# Altium schematic sheet УШЯИ.411618.029Э Э3 Лист 3new.schdoc
size 420 x 297 mm; SheetNumber: 3; SheetTotal: 7
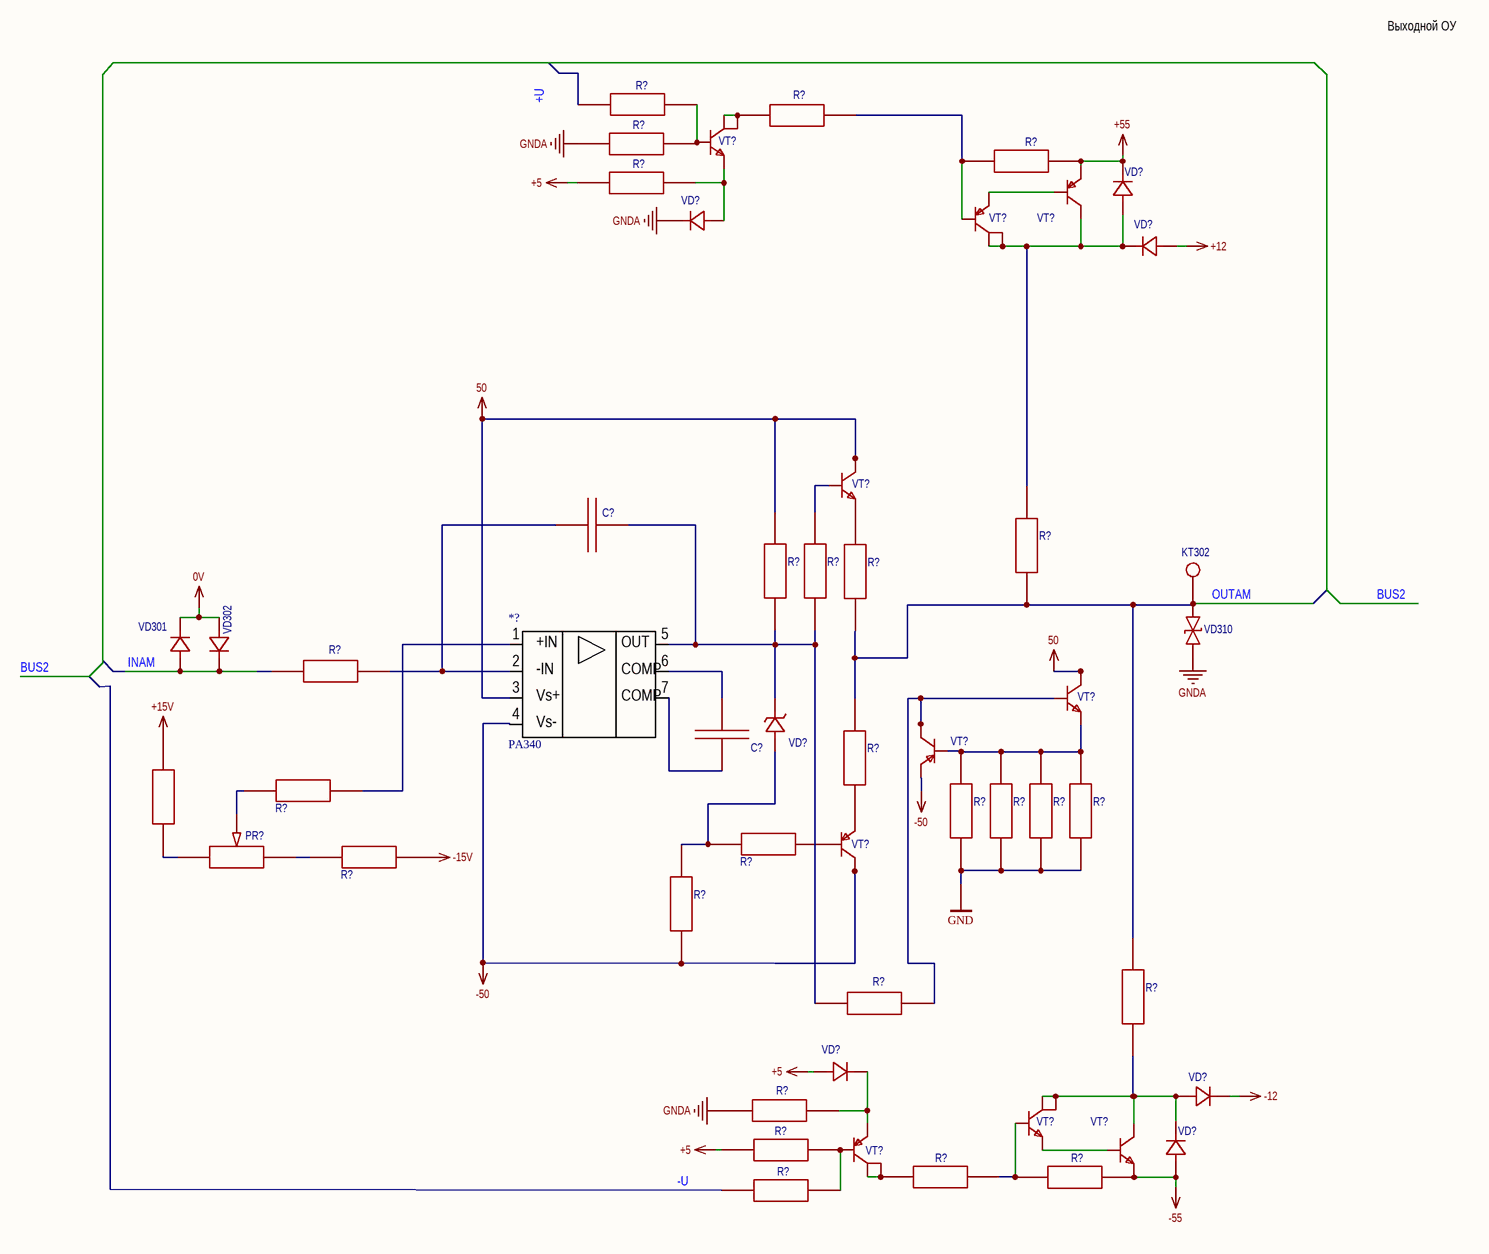
[diagram p0: УШЯИ.411618.029Э Э3 Лист 3new.schdoc]

## Parts
(Parts that share a designator on the sheet are numbered #1, #2 ... from top to bottom, then left to right.)
*?  PA340
?  Резистор 10кОм 0,125Вт 1% [0805]  [R0805]  (value not drawn)
C?#1  Конденсатор SMD 10пФ 100В X7R 10% [0805]  [C0805]  (value not drawn)
C?#2  Конденсатор SMD 30пФ 100В X7R 10% [0805]  [C0805]  (value not drawn)
KT302  Control point  (value not drawn)
PR?  Резистор переменный 3329Н 3.3 кОм  [RES-ADJ-TH_3329H]  (value not drawn)
R?#1  Резистор 3кОм 0,125Вт 1% [0805]  [R0805]  (value not drawn)
R?#2  Резистор 18кОм 0,125Вт 1% [0805]  [R0805]  (value not drawn)
R?#3  Резистор 2.4кОм 0,125Вт 1% [0805]  [R0805]  (value not drawn)
R?#4  Резистор 1.5кОм 0,125Вт 1% [0805]  [R0805]  (value not drawn)
R?#5  Резистор 7.2кОм 0,125Вт 1% [0805]  [R0805]  (value not drawn)
R?#6  Резистор 3кОм 0,125Вт 1% [0805]  [R0805]  (value not drawn)
R?#7  Резистор 10кОм 0,125Вт 1% [0805]  [R0805]  (value not drawn)
R?#8  Резистор 24Ом 0,125Вт 1% [0805]  [R0805]  (value not drawn)
R?#9  Резистор 3кОм 0,125Вт 1% [0805]  [R0805]  (value not drawn)
R?#10  Резистор 4кОм 0,125Вт 1% [0805]  [R0805]  (value not drawn)
R?#11  Резистор 3кОм 0,125Вт 1% [0805]  [R0805]  (value not drawn)
R?#12  Резистор 5кОм 0,125Вт 1% [0805]  [R0805]  (value not drawn)
R?#13  Резистор 3кОм 0,125Вт 1% [0805]  [R0805]  (value not drawn)
R?#14  Резистор 3кОм 0,125Вт 1% [0805]  [R0805]  (value not drawn)
R?#15  Резистор 3кОм 0,125Вт 1% [0805]  [R0805]  (value not drawn)
R?#16  Резистор 3кОм 0,125Вт 1% [0805]  [R0805]  (value not drawn)
R?#17  Резистор 24Ом 0,125Вт 1% [0805]  [R0805]  (value not drawn)
R?#18  Резистор 10кОм 0,125Вт 1% [0805]  [R0805]  (value not drawn)
R?#19  Резистор 10кОм 0,125Вт 1% [0805]  [R0805]  (value not drawn)
R?#20  Резистор 3кОм 0,125Вт 1% [0805]  [R0805]  (value not drawn)
R?#21  Резистор 3кОм 0,125Вт 1% [0805]  [R0805]  (value not drawn)
R?#22  Резистор 7.2кОм 0,125Вт 1% [0805]  [R0805]  (value not drawn)
R?#23  Резистор 2.4кОм 0,125Вт 1% [0805]  [R0805]  (value not drawn)
R?#24  Резистор 18кОм 0,125Вт 1% [0805]  [R0805]  (value not drawn)
R?#25  Резистор 1.5кОм 0,125Вт 1% [0805]  [R0805]  (value not drawn)
R?#26  Резистор 3кОм 0,125Вт 1% [0805]  [R0805]  (value not drawn)
VD301  Диод импульсный 1N4448 [SOD-123]  [SOD-123_L2.7-W1.6-LS3.7-RD-1]  (value not drawn)
VD302  Диод импульсный 1N4448 [SOD-123]  [SOD-123_L2.7-W1.6-LS3.7-RD-1]  (value not drawn)
VD310  Диод защитный 1.5KE56CA [DO-201AD/DO-27]  [DO-201]  (value not drawn)
VD?#1  Диод RS1M [SMA] (допускается замена на FR307 [DO-201AD])  (value not drawn)
VD?#2  Диод импульсный 1N4448 [SOD-123]  [SOD-123_L2.7-W1.6-LS3.7-RD-1]  (value not drawn)
VD?#3  Диод КД2970А [TO-220AC]  [TO-220AC-2_L10.0-W4.5-P5.08-T]  (value not drawn)
VD?#4  Стабилитрон MMSZ5232B 5.6В 0.5Вт [SOD123]  [SOD-123_L2.7-W1.6-LS3.7-RD]  (value not drawn)
VD?#5  Диод импульсный 1N4448 [SOD-123]  [SOD-123_L2.7-W1.6-LS3.7-RD-1]  (value not drawn)
VD?#6  Диод MBR10100 [TO-220AC]  [TO-220AC-2_L10.0-W4.5-P5.08-T]  (value not drawn)
VD?#7  Диод RS1M [SMA] (допускается замена на FR307 [DO-201AD])  (value not drawn)
VT?#1  Транзистор DZTA42 NPN [SOT223]  [SOT-223-4_L6.5-W3.5-P2.30-LS7.0-BR]  (value not drawn)
VT?#2  Транзистор MJE5730G PNP [TO-220-3]  [TO-220-3_L10.0-W4.5-P2.54-L]  (value not drawn)
VT?#3  Транзистор DZTA92 PNP [SOT223]  [SOT-223-3_L6.5-W3.4-P2.30-LS7.0-BR]  (value not drawn)
VT?#4  Транзистор TIP142 NPN [SOT223]  [SOT-223_L6.5-W3.5-P2.30-LS7.0-BR]  (value not drawn)
VT?#5  Транзистор ZTX658 NPN [SOT223]  [SOT-223_L6.5-W3.5-P2.30-LS7.0-BR]  (value not drawn)
VT?#6  Транзистор ZTX758 PNP [SOT223]  [SOT-223_L6.5-W3.5-P2.30-LS7.0-BR]  (value not drawn)
VT?#7  Транзистор TIP147 PNP [SOT223]  [SOT-223_L6.5-W3.5-P2.30-LS7.0-BR]  (value not drawn)
VT?#8  Транзистор DZTA42 NPN [SOT223]  [SOT-223-4_L6.5-W3.5-P2.30-LS7.0-BR]  (value not drawn)
VT?#9  Транзистор DZTA92 PNP [SOT223]  [SOT-223-3_L6.5-W3.4-P2.30-LS7.0-BR]  (value not drawn)
VT?#10  Транзистор TIP48 NPN [TO-220-3]  [TO-220-3_L10.0-W4.5-P2.54-L]  (value not drawn)

## Nets
0V: VD301.1(C) VD302.2(A)
50: *?.19 R?#7.2 VT?#4.2(C) VT?#4.4(C) VT?#5.2(C) VT?#5.4(C)
+5: R?#5.1 R?#23.1 VD?#5.2(A)
+12: VD?#3.3(A)
+15V: ?.1
+55: R?#4.2 VD?#1.1(K) VT?#2.3(E)
-12: VD?#6.1(K)
-15V: R?#18.1
-50: *?.18 R?#19.1 VT?#6.3(E) VT?#7.2(C) VT?#7.4(C)
-55: R?#25.2 VD?#7.2(A) VT?#10.3(E)
GND: R?#13.1 R?#14.1 R?#15.1 R?#16.1
GNDA: R?#3.1 R?#22.1 VD310.1 VD?#2.1(C)
-U: R?#26.1
INAM: R?#10.1 VD301.2(A) VD302.1(C)
OUTAM: KT302.1 R?#6.1 R?#9.1 R?#11.2 R?#20.2 VD310.2
Net*?_15: *?.15 C?#1.1 R?#7.1 R?#8.1 R?#21.1 VD?#4.1(K)
Net*?_16: *?.16 C?#2.1
Net*?_17: *?.17 C?#2.2
Net*?_20: *?.20 C?#1.2 R?#10.2
Net*?_21: *?.21 R?#12.2
Net?_2: ?.2 PR?.3
NetPR?_1: PR?.1 R?#18.2
NetPR?_2: PR?.2 R?#12.1
NetR?#1_2: R?#1.2 R?#3.2 VT?#1.1(B)
NetR?#2_1: R?#2.1 VT?#1.2(C) VT?#1.4(C)
NetR?#2_2: R?#2.2 R?#4.1 VT?#3.1(B)
NetR?#5_2: R?#5.2 VD?#2.2(A) VT?#1.3(E)
NetR?#6_2: R?#6.2 VD?#1.2(A) VD?#3.1(K) VT?#2.2(C) VT?#3.2(C) VT?#3.4(C)
NetR?#8_2: R?#8.2 VT?#4.1(B)
NetR?#9_2: R?#9.2 VT?#4.3(E)
NetR?#11_1: R?#11.1 VT?#7.3(E)
NetR?#13_2: R?#13.2 R?#14.2 R?#15.2 R?#16.2 VT?#5.3(E) VT?#6.1(B)
NetR?#17_1: R?#17.1 VT?#7.1(B)
NetR?#17_2: R?#17.2 R?#19.2 VD?#4.2(A)
NetR?#20_1: R?#20.1 VD?#6.3(A) VD?#7.1(K) VT?#8.2(C) VT?#8.4(C) VT?#10.2(C)
NetR?#21_2: R?#21.2 VT?#5.1(B) VT?#6.2(C) VT?#6.4(C)
NetR?#22_2: R?#22.2 VD?#5.1(C) VT?#9.3(E)
NetR?#23_2: R?#23.2 R?#26.2 VT?#9.1(B)
NetR?#24_1: R?#24.1 VT?#9.2(C) VT?#9.4(C)
NetR?#24_2: R?#24.2 R?#25.1 VT?#8.1(B)
NetVT?#2_1: VT?#2.1(B) VT?#3.3(E)
NetVT?#8_3: VT?#8.3(E) VT?#10.1(B)

Not connected (* = marked no-connect by the designer): R?#1 1

## Buses and harness runs
bus BUS2

## Notes on the sheet
- Выходной ОУ
- Labels drawn without touching a wire or pin: +U
- Подп. и дата
- Инв.№ дубл.
- Взам.инв.№
- Подп.и дата
- Инв.№ подл.
- Изм.
- Лист
- № докум.
- Подп.
- Дата
- Формат  A3
- (in symbol PA340) 1; 5; +IN; OUT; 2; 6; -IN; COMP; 3; 7; Vs+; 4; Vs-

## Library data of the parts
? R?#6-R?#21 = Резистор 3кОм 0,125Вт 1% [0805]: Contributor: jordanjin; Convert to PCB: yes; UniqueId: gge43217f4089893af2; ModelId: de27d504f5024d53a3020ec2611f5e5e; Origin Footprint: R0805; Device: Резистор 3кОм 0,125Вт 1% [0805]; Symbol: Резистор 3кОм 0,125Вт 1% [0805]; Manufacturer Part: R0805; spicePre: R; spiceSymbolName: Резистор 12кОм 0,125Вт 1% [0805]; Add into BOM: yes; FootprintName: R0805; ModelName: R0805
C?#1 C?#2 = Конденсатор SMD 10пФ 100В X7R 10% [0805]: Contributor: jordanjin; Convert to PCB: yes; UniqueId: ggedef2608488099cc0; Origin Footprint: C0805; Device: Конденсатор SMD 10пФ 100В X7R 10% [0805]; Symbol: Конденсатор SMD 10пФ 100В X7R 10% [0805]; Manufacturer Part: C0805; spicePre: C; spiceSymbolName: Конденсатор SMD 100нФ 100В X7R 10% [0805]; Add into BOM: yes; FootprintName: C0805
KT302 = Control point: Contributor: jordanjin; Convert to PCB: yes; UniqueId: ggefca8c0d1c63d776a; Origin Footprint: CONTROL POINT; Device: Control point; Symbol: Control point; Manufacturer Part: Control point; spicePre: K; spiceSymbolName: Control point; Add into BOM: yes
PR? = 47кОм: Manufacturer: BOCHEN; Manufacturer Part: 3329H; nameAlias: Value; Contributor: jordanjin; Convert to PCB: yes; UniqueId: gge1fcb3b6f1d9b0ac2; ModelId: 23beb460a8f44fd4bbfb4488e320892f; Origin Footprint: RES-ADJ-TH_3329H; Device: 47кОм; Symbol: 47кОм; Supplier: LCSC; JLCPCB Part Class: Extended Part; spicePre: R; spiceSymbolName: Резистор подстроречный 47кОм [3329H]; Add into BOM: yes; Resistance: 47кОм; FootprintName: RES-ADJ-TH_3329H; ModelName: RES-ADJ-TH_3329H
R?#1 = Резистор 3кОм 0,125Вт 1% [0805]: Contributor: jordanjin; Convert to PCB: yes; UniqueId: ggecdfd9e02ba7bc7b4; ModelId: de27d504f5024d53a3020ec2611f5e5e; Origin Footprint: R0805; Device: Резистор 3кОм 0,125Вт 1% [0805]; Symbol: Резистор 3кОм 0,125Вт 1% [0805]; Manufacturer Part: R0805; spicePre: R; spiceSymbolName: Резистор 12кОм 0,125Вт 1% [0805]; Add into BOM: yes; FootprintName: R0805; ModelName: R0805
R?#2 = Резистор 18кОм 0,125Вт 1% [0805]: Contributor: jordanjin; Convert to PCB: yes; UniqueId: gge5546a21a884c6307; ModelId: de27d504f5024d53a3020ec2611f5e5e; Origin Footprint: R0805; Device: Резистор 18кОм 0,125Вт 1% [0805]; Symbol: Резистор 18кОм 0,125Вт 1% [0805]; Manufacturer Part: R0805; spicePre: R; spiceSymbolName: Резистор 12кОм 0,125Вт 1% [0805]; Add into BOM: yes; FootprintName: R0805; ModelName: R0805
R?#3 = Резистор 2.4кОм 0,125Вт 1% [0805]: Contributor: jordanjin; Convert to PCB: yes; UniqueId: ggee22c828e250300a6; ModelId: de27d504f5024d53a3020ec2611f5e5e; Origin Footprint: R0805; Device: Резистор 2.4кОм 0,125Вт 1% [0805]; Symbol: Резистор 2.4кОм 0,125Вт 1% [0805]; Manufacturer Part: R0805; spicePre: R; spiceSymbolName: Резистор 12кОм 0,125Вт 1% [0805]; Add into BOM: yes; FootprintName: R0805; ModelName: R0805
R?#4 = Резистор 1.5кОм 0,125Вт 1% [0805]: Contributor: jordanjin; Convert to PCB: yes; UniqueId: gge3bd47006b7fd1579; ModelId: de27d504f5024d53a3020ec2611f5e5e; Origin Footprint: R0805; Device: Резистор 1.5кОм 0,125Вт 1% [0805]; Symbol: Резистор 1.5кОм 0,125Вт 1% [0805]; Manufacturer Part: R0805; spicePre: R; spiceSymbolName: Резистор 12кОм 0,125Вт 1% [0805]; Add into BOM: yes; FootprintName: R0805; ModelName: R0805
R?#5 = Резистор 7.2кОм 0,125Вт 1% [0805]: Contributor: jordanjin; Convert to PCB: yes; UniqueId: gge28b4fbf0dd659939; ModelId: de27d504f5024d53a3020ec2611f5e5e; Origin Footprint: R0805; Device: Резистор 7.2кОм 0,125Вт 1% [0805]; Symbol: Резистор 7.2кОм 0,125Вт 1% [0805]; Manufacturer Part: R0805; spicePre: R; spiceSymbolName: Резистор 12кОм 0,125Вт 1% [0805]; Add into BOM: yes; FootprintName: R0805; ModelName: R0805
R?#22 = Резистор 7.2кОм 0,125Вт 1% [0805]: Contributor: jordanjin; Convert to PCB: yes; UniqueId: gge859b26eaef412748; ModelId: de27d504f5024d53a3020ec2611f5e5e; Origin Footprint: R0805; Device: Резистор 7.2кОм 0,125Вт 1% [0805]; Symbol: Резистор 7.2кОм 0,125Вт 1% [0805]; Manufacturer Part: R0805; spicePre: R; spiceSymbolName: Резистор 12кОм 0,125Вт 1% [0805]; Add into BOM: yes; FootprintName: R0805; ModelName: R0805
R?#23 = Резистор 2.4кОм 0,125Вт 1% [0805]: Contributor: jordanjin; Convert to PCB: yes; UniqueId: gge5092b667f7a1fbe0; ModelId: de27d504f5024d53a3020ec2611f5e5e; Origin Footprint: R0805; Device: Резистор 2.4кОм 0,125Вт 1% [0805]; Symbol: Резистор 2.4кОм 0,125Вт 1% [0805]; Manufacturer Part: R0805; spicePre: R; spiceSymbolName: Резистор 12кОм 0,125Вт 1% [0805]; Add into BOM: yes; FootprintName: R0805; ModelName: R0805
R?#24 = Резистор 18кОм 0,125Вт 1% [0805]: Contributor: jordanjin; Convert to PCB: yes; UniqueId: gge9bc7b1efc6d85928; ModelId: de27d504f5024d53a3020ec2611f5e5e; Origin Footprint: R0805; Device: Резистор 18кОм 0,125Вт 1% [0805]; Symbol: Резистор 18кОм 0,125Вт 1% [0805]; Manufacturer Part: R0805; spicePre: R; spiceSymbolName: Резистор 12кОм 0,125Вт 1% [0805]; Add into BOM: yes; FootprintName: R0805; ModelName: R0805
R?#25 = Резистор 1.5кОм 0,125Вт 1% [0805]: Contributor: jordanjin; Convert to PCB: yes; UniqueId: gge53a59f0116c0d1f6; ModelId: de27d504f5024d53a3020ec2611f5e5e; Origin Footprint: R0805; Device: Резистор 1.5кОм 0,125Вт 1% [0805]; Symbol: Резистор 1.5кОм 0,125Вт 1% [0805]; Manufacturer Part: R0805; spicePre: R; spiceSymbolName: Резистор 12кОм 0,125Вт 1% [0805]; Add into BOM: yes; FootprintName: R0805; ModelName: R0805
R?#26 = Резистор 3кОм 0,125Вт 1% [0805]: Contributor: jordanjin; Convert to PCB: yes; UniqueId: ggef809131c8b71481b; ModelId: de27d504f5024d53a3020ec2611f5e5e; Origin Footprint: R0805; Device: Резистор 3кОм 0,125Вт 1% [0805]; Symbol: Резистор 3кОм 0,125Вт 1% [0805]; Manufacturer Part: R0805; spicePre: R; spiceSymbolName: Резистор 12кОм 0,125Вт 1% [0805]; Add into BOM: yes; FootprintName: R0805; ModelName: R0805
VD301 = Диод импульсный 1N4448 [SOD-123]: Manufacturer: YANGJIE; Manufacturer Part: 1N4448WQ; Contributor: jordanjin; Convert to PCB: yes; UniqueId: gge26c4b5a1da97e09a; ModelId: 5a61cd31046d4447ba73169a45a0935b; Origin Footprint: SOD-123_L2.7-W1.6-LS3.7-RD-1; Device: Диод импульсный 1N4448 [SOD-123]; Symbol: Диод импульсный 1N4448 [SOD-123]; Supplier: LCSC; JLCPCB Part Class: Extended Part; spicePre: V; spiceSymbolName: Диод импульсный 1N4448 [SOD-123]; Add into BOM: yes; FootprintName: SOD-123_L2.7-W1.6-LS3.7-RD-1; ModelName: SOD-123_L2.7-W1.6-LS3.7-RD-1
VD302 = Диод импульсный 1N4448 [SOD-123]: Manufacturer: YANGJIE; Manufacturer Part: 1N4448WQ; Contributor: jordanjin; Convert to PCB: yes; UniqueId: gge5cd0d772bae969d4; ModelId: 5a61cd31046d4447ba73169a45a0935b; Origin Footprint: SOD-123_L2.7-W1.6-LS3.7-RD-1; Device: Диод импульсный 1N4448 [SOD-123]; Symbol: Диод импульсный 1N4448 [SOD-123]; Supplier: LCSC; JLCPCB Part Class: Extended Part; spicePre: V; spiceSymbolName: Диод импульсный 1N4448 [SOD-123]; Add into BOM: yes; FootprintName: SOD-123_L2.7-W1.6-LS3.7-RD-1; ModelName: SOD-123_L2.7-W1.6-LS3.7-RD-1
VD310 = Диод защитный 1.5KE56CA [DO-201AD/DO-27]: Manufacturer: Littelfuse(美国力特); Origin Footprint: DO-201_BD5.1-L8.4-P15.24-D1.0-BI; Contributor: LCSC; Convert to PCB: yes; UniqueId: ggee131634947b93899; ModelId: 0f2f91941ec54a41b2d5742b791fe179; Device: Диод защитный 1.5KE56CA [DO-201AD/DO-27]; Symbol: Диод защитный 1.5KE56CA [DO-201AD/DO-27]; Supplier: LCSC; Supplier Part: C1973354; Manufacturer Part: 1.5KE56CA; JLCPCB Part Class: Extended Part; spicePre: D; spiceSymbolName: 1.5KE56CA_C1973354; Add into BOM: yes; FootprintName: DO-201_BD5.1-L8.4-P15.24-D1.0-BI; ModelName: DO-201_BD5.1-L8.4-P15.24-D1.0-BI
VD?#1 = Диод RS1M [SMA] (допускается замена на FR307 [DO-201AD]): Manufacturer: Wild Goose(威谷); Origin Footprint: SMA/DO-214AC; Contributor: lcsc; Convert to PCB: yes; UniqueId: gge794a92ba0b6788cd; Device: Диод RS1M [SMA] (допускается замена на FR307 [DO-201AD]); Symbol: Диод RS1M [SMA] (допускается замена на FR307 [DO-201AD]); Supplier: LCSC; Supplier Part: C22368778; Manufacturer Part: RS1M; JLCPCB Part Class: Extended Part; spicePre: D; spiceSymbolName: RS1M_C22368778; Add into BOM: yes
VD?#2 = Диод импульсный 1N4448 [SOD-123]: Manufacturer: YANGJIE; Manufacturer Part: 1N4448WQ; Contributor: jordanjin; Convert to PCB: yes; UniqueId: gge97cff0b923d9a97f; ModelId: 5a61cd31046d4447ba73169a45a0935b; Origin Footprint: SOD-123_L2.7-W1.6-LS3.7-RD-1; Device: Диод импульсный 1N4448 [SOD-123]; Symbol: Диод импульсный 1N4448 [SOD-123]; Supplier: LCSC; JLCPCB Part Class: Extended Part; spicePre: V; spiceSymbolName: Диод импульсный 1N4448 [SOD-123]; Add into BOM: yes; FootprintName: SOD-123_L2.7-W1.6-LS3.7-RD-1; ModelName: SOD-123_L2.7-W1.6-LS3.7-RD-1
VD?#3 = Диод КД2970А [TO-220AC]: Manufacturer: NH(纽航); Manufacturer Part: MUR1560F; Contributor: lcsc; Convert to PCB: yes; UniqueId: gged3dbbafcc699cb47; Origin Footprint: TO-220AC-2_L10.0-W4.5-P5.08-T; Device: Диод КД2970А [TO-220AC]; Symbol: Диод КД2970А [TO-220AC]; Supplier: LCSC; Supplier Part: C7427763; JLCPCB Part Class: Extended Part; spicePre: D; spiceSymbolName: MUR1560F; Add into BOM: yes; FootprintName: TO-220AC-2_L10.0-W4.5-P5.08-T
VD?#4 = Стабилитрон MMSZ5232B 5.6В 0.5Вт [SOD123]: Manufacturer: MCC(美微科); Manufacturer Part: MMSZ5232B-TP; Contributor: LCSC; Convert to PCB: yes; UniqueId: gge461a2574b730d459; Origin Footprint: SOD-123_L2.7-W1.6-LS3.7-RD; Device: Стабилитрон MMSZ5232B 5.6В 0.5Вт [SOD123]; Symbol: Стабилитрон MMSZ5232B 5.6В 0.5Вт [SOD123]; Supplier: LCSC; Supplier Part: C668974; JLCPCB Part Class: Extended Part; spicePre: D; spiceSymbolName: MMSZ5232B-TP; Add into BOM: yes; FootprintName: SOD-123_L2.7-W1.6-LS3.7-RD
VD?#5 = Диод импульсный 1N4448 [SOD-123]: Manufacturer: YANGJIE; Manufacturer Part: 1N4448WQ; Contributor: jordanjin; Convert to PCB: yes; UniqueId: gge179f786b32024c0a; ModelId: 5a61cd31046d4447ba73169a45a0935b; Origin Footprint: SOD-123_L2.7-W1.6-LS3.7-RD-1; Device: Диод импульсный 1N4448 [SOD-123]; Symbol: Диод импульсный 1N4448 [SOD-123]; Supplier: LCSC; JLCPCB Part Class: Extended Part; spicePre: V; spiceSymbolName: Диод импульсный 1N4448 [SOD-123]; Add into BOM: yes; FootprintName: SOD-123_L2.7-W1.6-LS3.7-RD-1; ModelName: SOD-123_L2.7-W1.6-LS3.7-RD-1
VD?#6 = Диод КД2970А [TO-220AC]: Manufacturer: NH(纽航); Manufacturer Part: MUR1560F; Contributor: lcsc; Convert to PCB: yes; UniqueId: gge4bf26c859eaa8598; Origin Footprint: TO-220AC-2_L10.0-W4.5-P5.08-T; Device: Диод КД2970А [TO-220AC]; Symbol: Диод КД2970А [TO-220AC]; Supplier: LCSC; Supplier Part: C7427763; JLCPCB Part Class: Extended Part; spicePre: D; spiceSymbolName: MUR1560F; Add into BOM: yes; FootprintName: TO-220AC-2_L10.0-W4.5-P5.08-T
VD?#7 = Диод RS1M [SMA] (допускается замена на FR307 [DO-201AD]): Manufacturer: Wild Goose(威谷); Origin Footprint: SMA/DO-214AC; Contributor: lcsc; Convert to PCB: yes; UniqueId: ggeaa0dfd477a3fa1b3; Device: Диод RS1M [SMA] (допускается замена на FR307 [DO-201AD]); Symbol: Диод RS1M [SMA] (допускается замена на FR307 [DO-201AD]); Supplier: LCSC; Supplier Part: C22368778; Manufacturer Part: RS1M; JLCPCB Part Class: Extended Part; spicePre: D; spiceSymbolName: RS1M_C22368778; Add into BOM: yes
VT?#1 = Транзистор DZTA42 NPN [SOT223]: Manufacturer: DIODES(美台); Manufacturer Part: DZTA42-13; Contributor: LCSC; Convert to PCB: yes; UniqueId: gge2c6f7b2339f7cfb0; Origin Footprint: SOT-223-4_L6.5-W3.5-P2.30-LS7.0-BR; Device: Транзистор DZTA42 NPN [SOT223]; Symbol: Транзистор DZTA42 NPN [SOT223]; Supplier: LCSC; Supplier Part: C531150; JLCPCB Part Class: Extended Part; spicePre: Q; spiceSymbolName: DZTA42-13; Add into BOM: yes; FootprintName: SOT-223-4_L6.5-W3.5-P2.30-LS7.0-BR
VT?#2 = Транзистор MJE5730G PNP [TO-220-3]: Manufacturer: onsemi(安森美); Contributor: LCSC; Convert to PCB: yes; UniqueId: gge5eed697d29ebfe8b; ModelId: 37b5e9fc6b50491dae7b150eb9821ae3; Origin Footprint: TO-220-3_L10.0-W4.5-P2.54-L; Device: Транзистор MJE5730G PNP [TO-220-3]; Symbol: Транзистор MJE5730G PNP [TO-220-3]; Supplier: LCSC; Supplier Part: C897091; Manufacturer Part: MJE5730G; JLCPCB Part Class: Extended Part; spicePre: Q; spiceSymbolName: MJE5730G; Add into BOM: yes; FootprintName: TO-220-3_L10.0-W4.5-P2.54-L; ModelName: TO-220-3_L10.0-W4.5-P2.54-L
VT?#3 = Транзистор DZTA92 PNP [SOT223]: Manufacturer: DIODES(美台); Manufacturer Part: DZTA92-13; Contributor: lcsc; Convert to PCB: yes; UniqueId: ggeab0a8fe0e3572336; Origin Footprint: SOT-223-3_L6.5-W3.4-P2.30-LS7.0-BR; Device: Транзистор DZTA92 PNP [SOT223]; Symbol: Транзистор DZTA92 PNP [SOT223]; Supplier: LCSC; Supplier Part: C5205190; JLCPCB Part Class: Extended Part; spicePre: Q; spiceSymbolName: DZTA92-13; Add into BOM: yes; FootprintName: SOT-223-3_L6.5-W3.4-P2.30-LS7.0-BR
VT?#4 VT?#5 = Транзистор FZT658 NPN [SOT223]: Manufacturer: DIODES(美台); Manufacturer Part: FZT658; Contributor: lcsc; Convert to PCB: yes; UniqueId: gge36d44b89134af167; Origin Footprint: SOT-223_L6.5-W3.5-P2.30-LS7.0-BR; Device: Транзистор FZT658 NPN [SOT223]; Symbol: Транзистор FZT658 NPN [SOT223]; Supplier: LCSC; Supplier Part: C5245513; JLCPCB Part Class: Extended Part; spicePre: Q; spiceSymbolName: FZT658; Add into BOM: yes; FootprintName: SOT-223_L6.5-W3.5-P2.30-LS7.0-BR
VT?#6 VT?#7 = Транзистор FZT758 PNP [SOT223]: Manufacturer: DIODES(美台); Manufacturer Part: FZT758TA; Contributor: LCSC; Convert to PCB: yes; UniqueId: gged3d453d57ec37b7c; Origin Footprint: SOT-223_L6.5-W3.5-P2.30-LS7.0-BR; Device: Транзистор FZT758 PNP [SOT223]; Symbol: Транзистор FZT758 PNP [SOT223]; Supplier: LCSC; Supplier Part: C99123; JLCPCB Part Class: Extended Part; spicePre: Q; spiceSymbolName: FZT758TA; Add into BOM: yes; FootprintName: SOT-223_L6.5-W3.5-P2.30-LS7.0-BR
VT?#8 = Транзистор DZTA42 NPN [SOT223]: Manufacturer: DIODES(美台); Manufacturer Part: DZTA42-13; Contributor: LCSC; Convert to PCB: yes; UniqueId: ggea7a9202f086c4e5b; Origin Footprint: SOT-223-4_L6.5-W3.5-P2.30-LS7.0-BR; Device: Транзистор DZTA42 NPN [SOT223]; Symbol: Транзистор DZTA42 NPN [SOT223]; Supplier: LCSC; Supplier Part: C531150; JLCPCB Part Class: Extended Part; spicePre: Q; spiceSymbolName: DZTA42-13; Add into BOM: yes; FootprintName: SOT-223-4_L6.5-W3.5-P2.30-LS7.0-BR
VT?#9 = Транзистор DZTA92 PNP [SOT223]: Manufacturer: DIODES(美台); Manufacturer Part: DZTA92-13; Contributor: lcsc; Convert to PCB: yes; UniqueId: gge53a830cd39e0fe90; Origin Footprint: SOT-223-3_L6.5-W3.4-P2.30-LS7.0-BR; Device: Транзистор DZTA92 PNP [SOT223]; Symbol: Транзистор DZTA92 PNP [SOT223]; Supplier: LCSC; Supplier Part: C5205190; JLCPCB Part Class: Extended Part; spicePre: Q; spiceSymbolName: DZTA92-13; Add into BOM: yes; FootprintName: SOT-223-3_L6.5-W3.4-P2.30-LS7.0-BR
VT?#10 = Транзистор TIP48 NPN [TO-220-3]: Manufacturer: onsemi(安森美); Manufacturer Part: TIP48G; Contributor: lcsc; Convert to PCB: yes; UniqueId: gge2b3603b9172bdb05; ModelId: 37b5e9fc6b50491dae7b150eb9821ae3; Origin Footprint: TO-220-3_L10.0-W4.5-P2.54-L; Device: Транзистор TIP48 NPN [TO-220-3]; Symbol: Транзистор TIP48 NPN [TO-220-3]; Supplier: LCSC; Supplier Part: C233726; JLCPCB Part Class: Extended Part; spicePre: Q; spiceSymbolName: TIP48G; Add into BOM: yes; FootprintName: TO-220-3_L10.0-W4.5-P2.54-L; ModelName: TO-220-3_L10.0-W4.5-P2.54-L